# EasyEDA Pro project honglin-first_crt_smartphone-e4cb491d.epro, board 灯板1
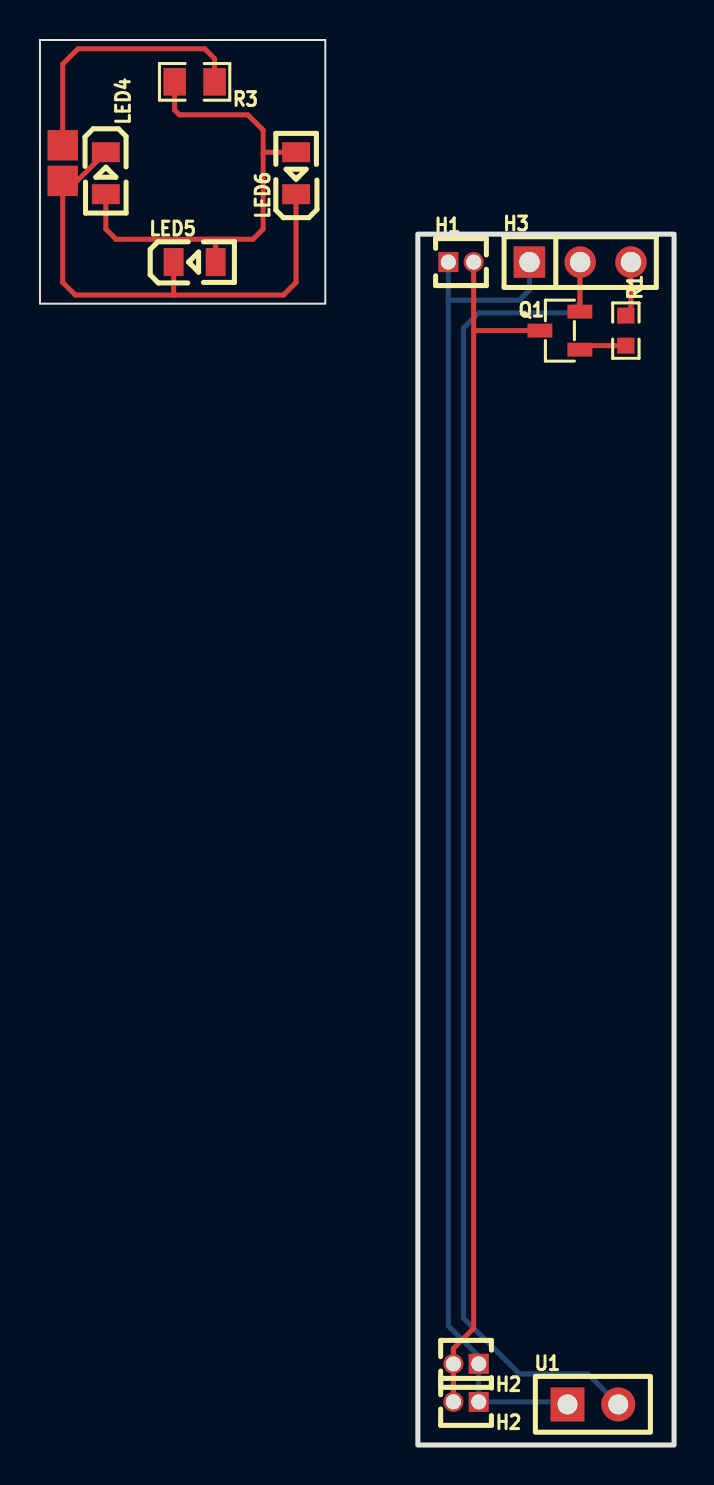
[diagram p13: board, top side]
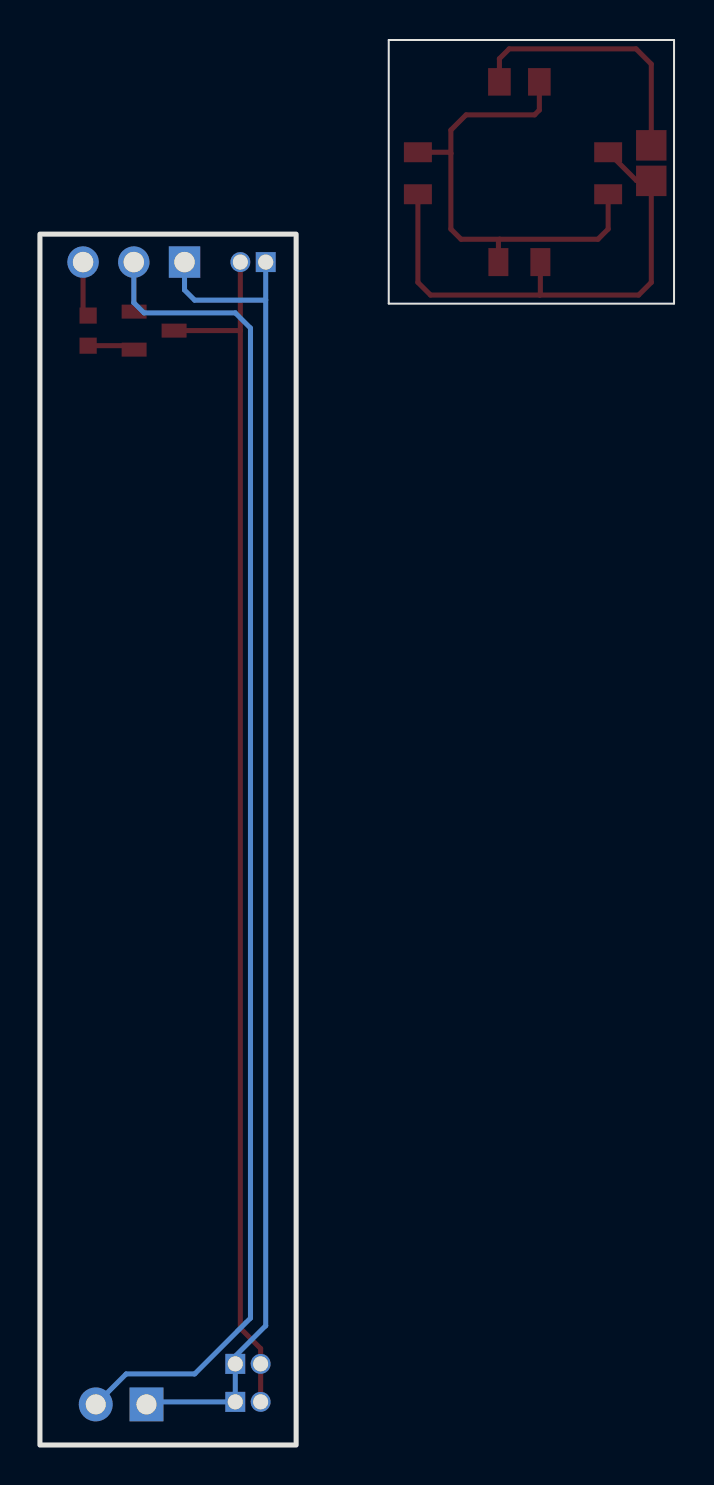
[diagram p14: board, bottom side, seen from below]

Outline 31.75 x 70.29 mm; copper layers: Top Layer, Bottom Layer. Coordinates in mm from the lower left corner of the outline.
Outline path: rectangle 18.92,60.58 31.75,0 ; 0,70.29 14.28,70.29 14.28,57.1 0,57.1 0,70.29
Stack: Top Layer 0.035mm / Dielectric1 1.51mm FR4 er 4.5 / Bottom Layer 0.035mm

## Design rules (mm)
spacing copperThickness1oz (default): track to track 0.102, other pairs 0.152 to 0.3
spacing copperThickness2oz: track to track 0.203, other pairs 0.152 to 0.3
spacing Plane_innerPlane: track to track 0.102, other pairs 0.152 to 0.3
spacing Copper_copperRegion: track to track 0.102, other pairs 0.152 to 0.3
track width copperThickness1oz (default): min 0.127, default 0.254, max 2.54
track width copperThickness2oz: min 0.203, default 0.254, max 2.54
differential pair differentialPair (default): width min 0.127, default 0.254, max 2.54; gap min 0.152, default 0.152

## Placement (name value [footprint] x y rotation side)
H1  DZ127R-11-02-25  [HDR-TH_2P-P1.27-V-M]  21.08 59.18 0 top
H2  DZ127R-11-02-25  [HDR-TH_2P-P1.27-V-M]  21.33 4.06 180 top
H2#2  -  [HDR-TH_2P-P1.27-V-M]  21.33 2.16 180 top
H3  PM254V-11-03-H85  [HDR-TH_3P-P2.54-V-F]  27.05 59.18 0 top
LED4  KT-0805G  [LED0805-R-RD]  3.3 63.63 270 top
LED5  KT-0805G  [LED0805-R-RD]  7.74 59.18 0 top
LED6  KT-0805G  [LED0805-R-RD]  12.82 63.63 90 top
NOREF  -  [Pad_e2]  1.14 63.25 0 top
NOREF#2  -  [Pad_e1]  1.14 65.02 0 top
Q1  S8050  [SOT-23-3_L2.9-W1.3-P1.90-LS2.4-BR]  26.03 55.75 0 top
R1  1kΩ  [R0603]  29.33 55.75 270 top
R3  50Ω  [R0805]  7.74 68.2 0 top
U1  PM254-1-02-Z-8.5  [HDR-TH_2P-P2.54-V-F]  27.68 2.03 0 top

## Footprints (pads in the part's own frame, mm; a bottom-side part is the same pattern mirrored in y, then rotated)
HDR-TH_2P-P1.27-V-M
  rect 1x1 hole 0.75: 1(-0.635,0)
  round 1 hole 0.75: 2(0.635,0)
HDR-TH_2P-P2.54-V-F
  rect 1.7x1.7 hole 1: 1(-1.27,0)
  round 1.7 hole 1: 2(1.27,0)
HDR-TH_3P-P2.54-V-F
  rect 1.575x1.575 hole 1.02: 1(-2.54,0)
  round 1.575 hole 1.02: 2(0,0) 3(2.54,0)
LED0805-R-RD
  rect 1x1.399 smd: 1(1.05,0) 2(-1.05,0)
Pad_e1
  rect 1.524x1.524 smd: 4(0,0)
Pad_e2
  rect 1.524x1.524 smd: 4(0,0)
R0603
  rect 0.806x0.864 smd: 1(-0.753,0) 2(0.753,0)
R0805
  rect 1.133x1.377 smd: 1(-1,0) 2(1,0)
SOT-23-3_L2.9-W1.3-P1.90-LS2.4-BR
  rect 1.25x0.7 smd: 1(1,-0.95) 2(1,0.95) 3(-1,0)

## Nets
+5V: H1.1 H2.1 H2#2.1 H3.1 U1.1
GND: LED4.2 LED5.2 LED6.2 NOREF.4
PGND: H3.2 Q1.2 U1.2
VCC: NOREF#2.4 R3.2
CONTROL: H3.3 R1.1
$1N371: Q1.1 R1.2
$1N727: LED4.1 LED5.1 LED6.1 R3.1
$1N876: H1.2 H2.2 H2#2.2 Q1.3

## Routing (per net, layer and track width the routed paths; a pad name or vN(x,y) marks a point on that pad's centre or on a via; arc(x,y) is an arc through that point)
+5V: length 67.8
  Bottom Layer w0.254: H3.1 24.51,57.79 24,57.28 20.44,57.28 ; 20.44,57.28 H1.1 ; 20.44,57.28 20.44,5.97 21.97,4.44 H2#2.1 26.29,2.16 U1.1
GND: length 26.5
  Top Layer w0.254: LED6.2 12.82,58.17 12.19,57.53 6.72,57.53 ; LED5.2 6.69,57.56 6.72,57.53 ; LED4.2 1.89,63.27 0.89,63.27 1.14,63.01 1.14,58.17 1.77,57.53 6.72,57.53
PGND: length 70
  Top Layer w0.254: Q1.2 27.03,59.17 H3.2
  Bottom Layer w0.254: H3.2 27.05,57.15 26.54,56.64 21.97,56.64 21.21,55.88 21.21,6.35 24,3.56 27.43,3.56 U1.2
VCC: length 13.5
  Top Layer w0.254: 0.89,65.02 1.14,65.28 1.14,69.09 1.9,69.85 8.25,69.85 8.74,69.36 R3.2
CONTROL: length 2.8
  Top Layer w0.254: H3.3 29.59,56.76 R1.1
$1N371: length 2.4
  Top Layer w0.254: R1.2 27.23,55 Q1.1
$1N727: length 24.1
  Top Layer w0.254: LED6.1 11.23,64.68 11.17,64.62 ; LED4.1 3.3,60.83 3.81,60.33 8.74,60.33 ; 11.17,64.62 11.17,65.79 10.41,66.55 6.98,66.55 6.74,66.79 R3.1 ; 11.17,64.62 11.17,60.83 10.66,60.33 8.74,60.33 ; 8.74,60.33 8.79,60.27 LED5.1
$1N876: length 60.8
  Top Layer w0.254: 21.71,55.75 H1.2 ; 21.71,55.75 21.71,5.84 20.7,4.83 H2.2 H2#2.2 ; 21.71,55.75 Q1.3
